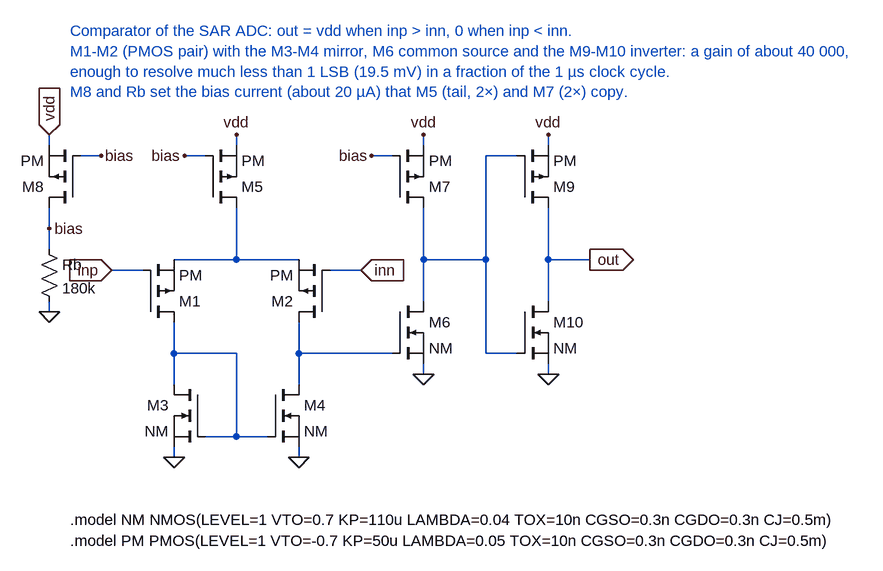
[diagram p0: schematic COMP.asc]
COMP.asc, the LTspice schematic file:
Version 4
SHEET 1 1000 700
WIRE 32 0 32 -16
WIRE 80 16 112 16
WIRE 32 96 32 128
WIRE 32 128 32 160
WIRE 32 240 32 256
WIRE 320 0 320 -16
WIRE 272 16 240 16
WIRE 320 96 320 176
WIRE 224 176 320 176
WIRE 320 176 416 176
WIRE 176 192 128 192
WIRE 464 192 512 192
WIRE 224 272 224 320
WIRE 224 320 224 368
WIRE 224 320 320 320
WIRE 320 320 320 448
WIRE 272 448 320 448
WIRE 320 448 368 448
WIRE 224 464 224 480
WIRE 416 464 416 480
WIRE 416 272 416 320
WIRE 416 320 416 368
WIRE 416 320 560 320
WIRE 608 336 608 352
WIRE 608 0 608 -16
WIRE 560 16 528 16
WIRE 608 96 608 176
WIRE 608 176 608 240
WIRE 800 0 800 -16
WIRE 608 176 704 176
WIRE 752 16 704 16
WIRE 704 16 704 176
WIRE 704 176 704 320
WIRE 704 320 752 320
WIRE 800 96 800 176
WIRE 800 176 800 240
WIRE 800 176 864 176
WIRE 800 336 800 352
FLAG 32 -16 vdd
IOPIN 32 -16 In
FLAG 112 16 bias
FLAG 32 128 bias
FLAG 32 256 0
FLAG 320 -16 vdd
FLAG 240 16 bias
FLAG 128 192 inp
IOPIN 128 192 In
FLAG 512 192 inn
IOPIN 512 192 In
FLAG 224 480 0
FLAG 416 480 0
FLAG 608 352 0
FLAG 608 -16 vdd
FLAG 528 16 bias
FLAG 800 -16 vdd
FLAG 864 176 out
IOPIN 864 176 Out
FLAG 800 352 0
SYMBOL pmos 80 96 R180
SYMATTR InstName M8
SYMATTR Value PM
SYMATTR Value2 l=1u w=10u
SYMBOL res 16 144 R0
SYMATTR InstName Rb
SYMATTR Value 180k
SYMBOL pmos 272 96 M180
SYMATTR InstName M5
SYMATTR Value PM
SYMATTR Value2 l=1u w=20u
SYMBOL pmos 176 272 M180
SYMATTR InstName M1
SYMATTR Value PM
SYMATTR Value2 l=1u w=20u
SYMBOL pmos 464 272 R180
SYMATTR InstName M2
SYMATTR Value PM
SYMATTR Value2 l=1u w=20u
SYMBOL nmos 272 368 M0
SYMATTR InstName M3
SYMATTR Value NM
SYMATTR Value2 l=1u w=5u
SYMBOL nmos 368 368 R0
SYMATTR InstName M4
SYMATTR Value NM
SYMATTR Value2 l=1u w=5u
SYMBOL nmos 560 240 R0
SYMATTR InstName M6
SYMATTR Value NM
SYMATTR Value2 l=1u w=10u
SYMBOL pmos 560 96 M180
SYMATTR InstName M7
SYMATTR Value PM
SYMATTR Value2 l=1u w=20u
SYMBOL pmos 752 96 M180
SYMATTR InstName M9
SYMATTR Value PM
SYMATTR Value2 l=1u w=4u
SYMBOL nmos 752 240 R0
SYMATTR InstName M10
SYMATTR Value NM
SYMATTR Value2 l=1u w=2u
TEXT 64 -176 Left 2 ;Comparator of the SAR ADC: out = vdd when inp > inn, 0 when inp < inn.\nM1-M2 (PMOS pair) with the M3-M4 mirror, M6 common source and the M9-M10 inverter: a gain of about 40 000,\nenough to resolve much less than 1 LSB (19.5 mV) in a fraction of the 1 µs clock cycle.\nM8 and Rb set the bias current (about 20 µA) that M5 (tail, 2×) and M7 (2×) copy.
TEXT 64 576 Left 2 !.model NM NMOS(LEVEL=1 VTO=0.7 KP=110u LAMBDA=0.04 TOX=10n CGSO=0.3n CGDO=0.3n CJ=0.5m)
TEXT 64 608 Left 2 !.model PM PMOS(LEVEL=1 VTO=-0.7 KP=50u LAMBDA=0.05 TOX=10n CGSO=0.3n CGDO=0.3n CJ=0.5m)

The netlist it stands for:
* COMP.asc
M8 bias bias vdd vdd PM l=1u w=10u
Rb bias 0 180k
M5 N001 bias vdd vdd PM l=1u w=20u
M1 N002 inp N001 N001 PM l=1u w=20u
M2 N003 inn N001 N001 PM l=1u w=20u
M3 N002 N002 0 0 NM l=1u w=5u
M4 N003 N002 0 0 NM l=1u w=5u
M6 N004 N003 0 0 NM l=1u w=10u
M7 N004 bias vdd vdd PM l=1u w=20u
M9 out N004 vdd vdd PM l=1u w=4u
M10 out N004 0 0 NM l=1u w=2u
.model NMOS NMOS
.model PMOS PMOS
.lib standard.mos
* Comparator of the SAR ADC: out = vdd when inp > inn, 0 when inp < inn.
* M1-M2 (PMOS pair) with the M3-M4 mirror, M6 common source and the M9-M10 inverter: a gain of about 40 000,
* enough to resolve much less than 1 LSB (19.5 mV) in a fraction of the 1 µs clock cycle.
* M8 and Rb set the bias current (about 20 µA) that M5 (tail, 2×) and M7 (2×) copy.
.model NM NMOS(LEVEL=1 VTO=0.7 KP=110u LAMBDA=0.04 TOX=10n CGSO=0.3n CGDO=0.3n CJ=0.5m)
.model PM PMOS(LEVEL=1 VTO=-0.7 KP=50u LAMBDA=0.05 TOX=10n CGSO=0.3n CGDO=0.3n CJ=0.5m)
.backanno
.end